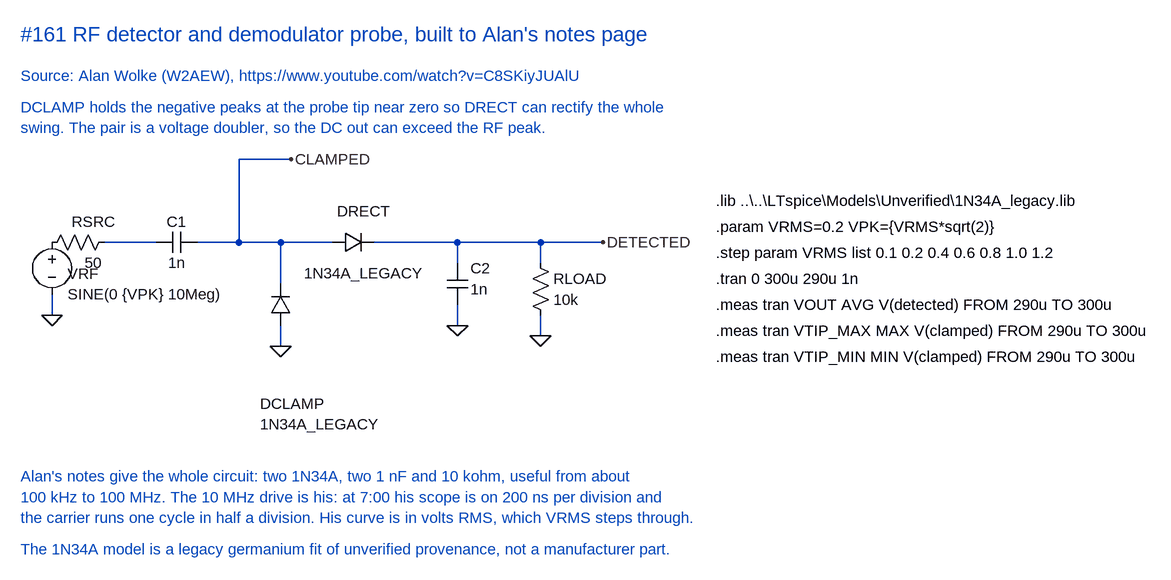
[diagram p0: schematic RF detector probe.asc]
RF detector probe.asc, the LTspice schematic file:
Version 4
SHEET 1 2000 1000
WIRE 288 320 368 320
WIRE 432 320 496 320
WIRE 496 320 560 320
WIRE 560 320 640 320
WIRE 496 320 496 192
WIRE 496 192 576 192
WIRE 560 320 560 384
WIRE 560 448 560 480
WIRE 704 320 832 320
WIRE 832 320 960 320
WIRE 960 320 1056 320
WIRE 832 320 832 352
WIRE 832 416 832 448
WIRE 960 320 960 352
WIRE 960 432 960 464
WIRE 208 400 208 432
FLAG 208 432 0
FLAG 560 480 0
FLAG 832 448 0
FLAG 960 464 0
FLAG 576 192 CLAMPED
FLAG 1056 320 DETECTED
SYMBOL voltage 208 304 R0
WINDOW 0 24 64 Left 2
WINDOW 3 24 96 Left 2
SYMATTR InstName VRF
SYMATTR Value SINE(0 {VPK} 10Meg)
SYMBOL res 304 304 R90
WINDOW 0 0 32 VBottom 2
WINDOW 3 32 32 VTop 2
SYMATTR InstName RSRC
SYMATTR Value 50
SYMBOL cap 432 304 R90
WINDOW 0 0 32 VBottom 2
WINDOW 3 32 32 VTop 2
SYMATTR InstName C1
SYMATTR Value 1n
SYMBOL diode 576 448 R180
WINDOW 0 48 -120 Right 2
WINDOW 3 48 -152 Right 2
SYMATTR InstName DCLAMP
SYMATTR Value 1N34A_LEGACY
SYMBOL diode 640 336 R270
WINDOW 0 48 48 VTop 2
WINDOW 3 -16 48 VBottom 2
SYMATTR InstName DRECT
SYMATTR Value 1N34A_LEGACY
SYMBOL cap 816 352 R0
WINDOW 0 36 8 Left 2
WINDOW 3 36 40 Left 2
SYMATTR InstName C2
SYMATTR Value 1n
SYMBOL res 944 336 R0
WINDOW 0 36 40 Left 2
WINDOW 3 36 72 Left 2
SYMATTR InstName RLOAD
SYMATTR Value 10k
TEXT 160 0 Left 3 ;#161 RF detector and demodulator probe, built to Alan's notes page
TEXT 160 64 Left 2 ;Source: Alan Wolke (W2AEW), https://www.youtube.com/watch?v=C8SKiyJUAlU
TEXT 160 112 Left 2 ;DCLAMP holds the negative peaks at the probe tip near zero so DRECT can rectify the whole
TEXT 160 144 Left 2 ;swing. The pair is a voltage doubler, so the DC out can exceed the RF peak.
TEXT 1230 256 Left 2 !.lib ..\..\LTspice\Models\Unverified\1N34A_legacy.lib
TEXT 1230 296 Left 2 !.param VRMS=0.2 VPK={VRMS*sqrt(2)}
TEXT 1230 336 Left 2 !.step param VRMS list 0.1 0.2 0.4 0.6 0.8 1.0 1.2
TEXT 1230 376 Left 2 !.tran 0 300u 290u 1n
TEXT 1230 416 Left 2 !.meas tran VOUT AVG V(detected) FROM 290u TO 300u
TEXT 1230 456 Left 2 !.meas tran VTIP_MAX MAX V(clamped) FROM 290u TO 300u
TEXT 1230 496 Left 2 !.meas tran VTIP_MIN MIN V(clamped) FROM 290u TO 300u
TEXT 160 680 Left 2 ;Alan's notes give the whole circuit: two 1N34A, two 1 nF and 10 kohm, useful from about
TEXT 160 712 Left 2 ;100 kHz to 100 MHz. The 10 MHz drive is his: at 7:00 his scope is on 200 ns per division and
TEXT 160 744 Left 2 ;the carrier runs one cycle in half a division. His curve is in volts RMS, which VRMS steps through.
TEXT 160 792 Left 2 ;The 1N34A model is a legacy germanium fit of unverified provenance, not a manufacturer part.

The netlist it stands for:
* RF detector probe.asc
VRF P001 0 SINE(0 {VPK} 10Meg)
RSRC N001 P001 50
C1 CLAMPED N001 1n
DCLAMP 0 CLAMPED 1N34A_LEGACY
DRECT CLAMPED DETECTED 1N34A_LEGACY
C2 DETECTED 0 1n
RLOAD DETECTED 0 10k
.model D D
.lib standard.dio
* #161 RF detector and demodulator probe, built to Alan's notes page
* Source: Alan Wolke (W2AEW), https://www.youtube.com/watch?v=C8SKiyJUAlU
* DCLAMP holds the negative peaks at the probe tip near zero so DRECT can rectify the whole
* swing. The pair is a voltage doubler, so the DC out can exceed the RF peak.
.lib ..\..\LTspice\Models\Unverified\1N34A_legacy.lib
.param VRMS=0.2 VPK={VRMS*sqrt(2)}
.step param VRMS list 0.1 0.2 0.4 0.6 0.8 1.0 1.2
.tran 0 300u 290u 1n
.meas tran VOUT AVG V(detected) FROM 290u TO 300u
.meas tran VTIP_MAX MAX V(clamped) FROM 290u TO 300u
.meas tran VTIP_MIN MIN V(clamped) FROM 290u TO 300u
* Alan's notes give the whole circuit: two 1N34A, two 1 nF and 10 kohm, useful from about
* 100 kHz to 100 MHz. The 10 MHz drive is his: at 7:00 his scope is on 200 ns per division and
* the carrier runs one cycle in half a division. His curve is in volts RMS, which VRMS steps through.
* The 1N34A model is a legacy germanium fit of unverified provenance, not a manufacturer part.
.backanno
.end